# Altium schematic sheet IOs.SchDoc
size A3; SheetNumber: 9; SheetTotal: 9
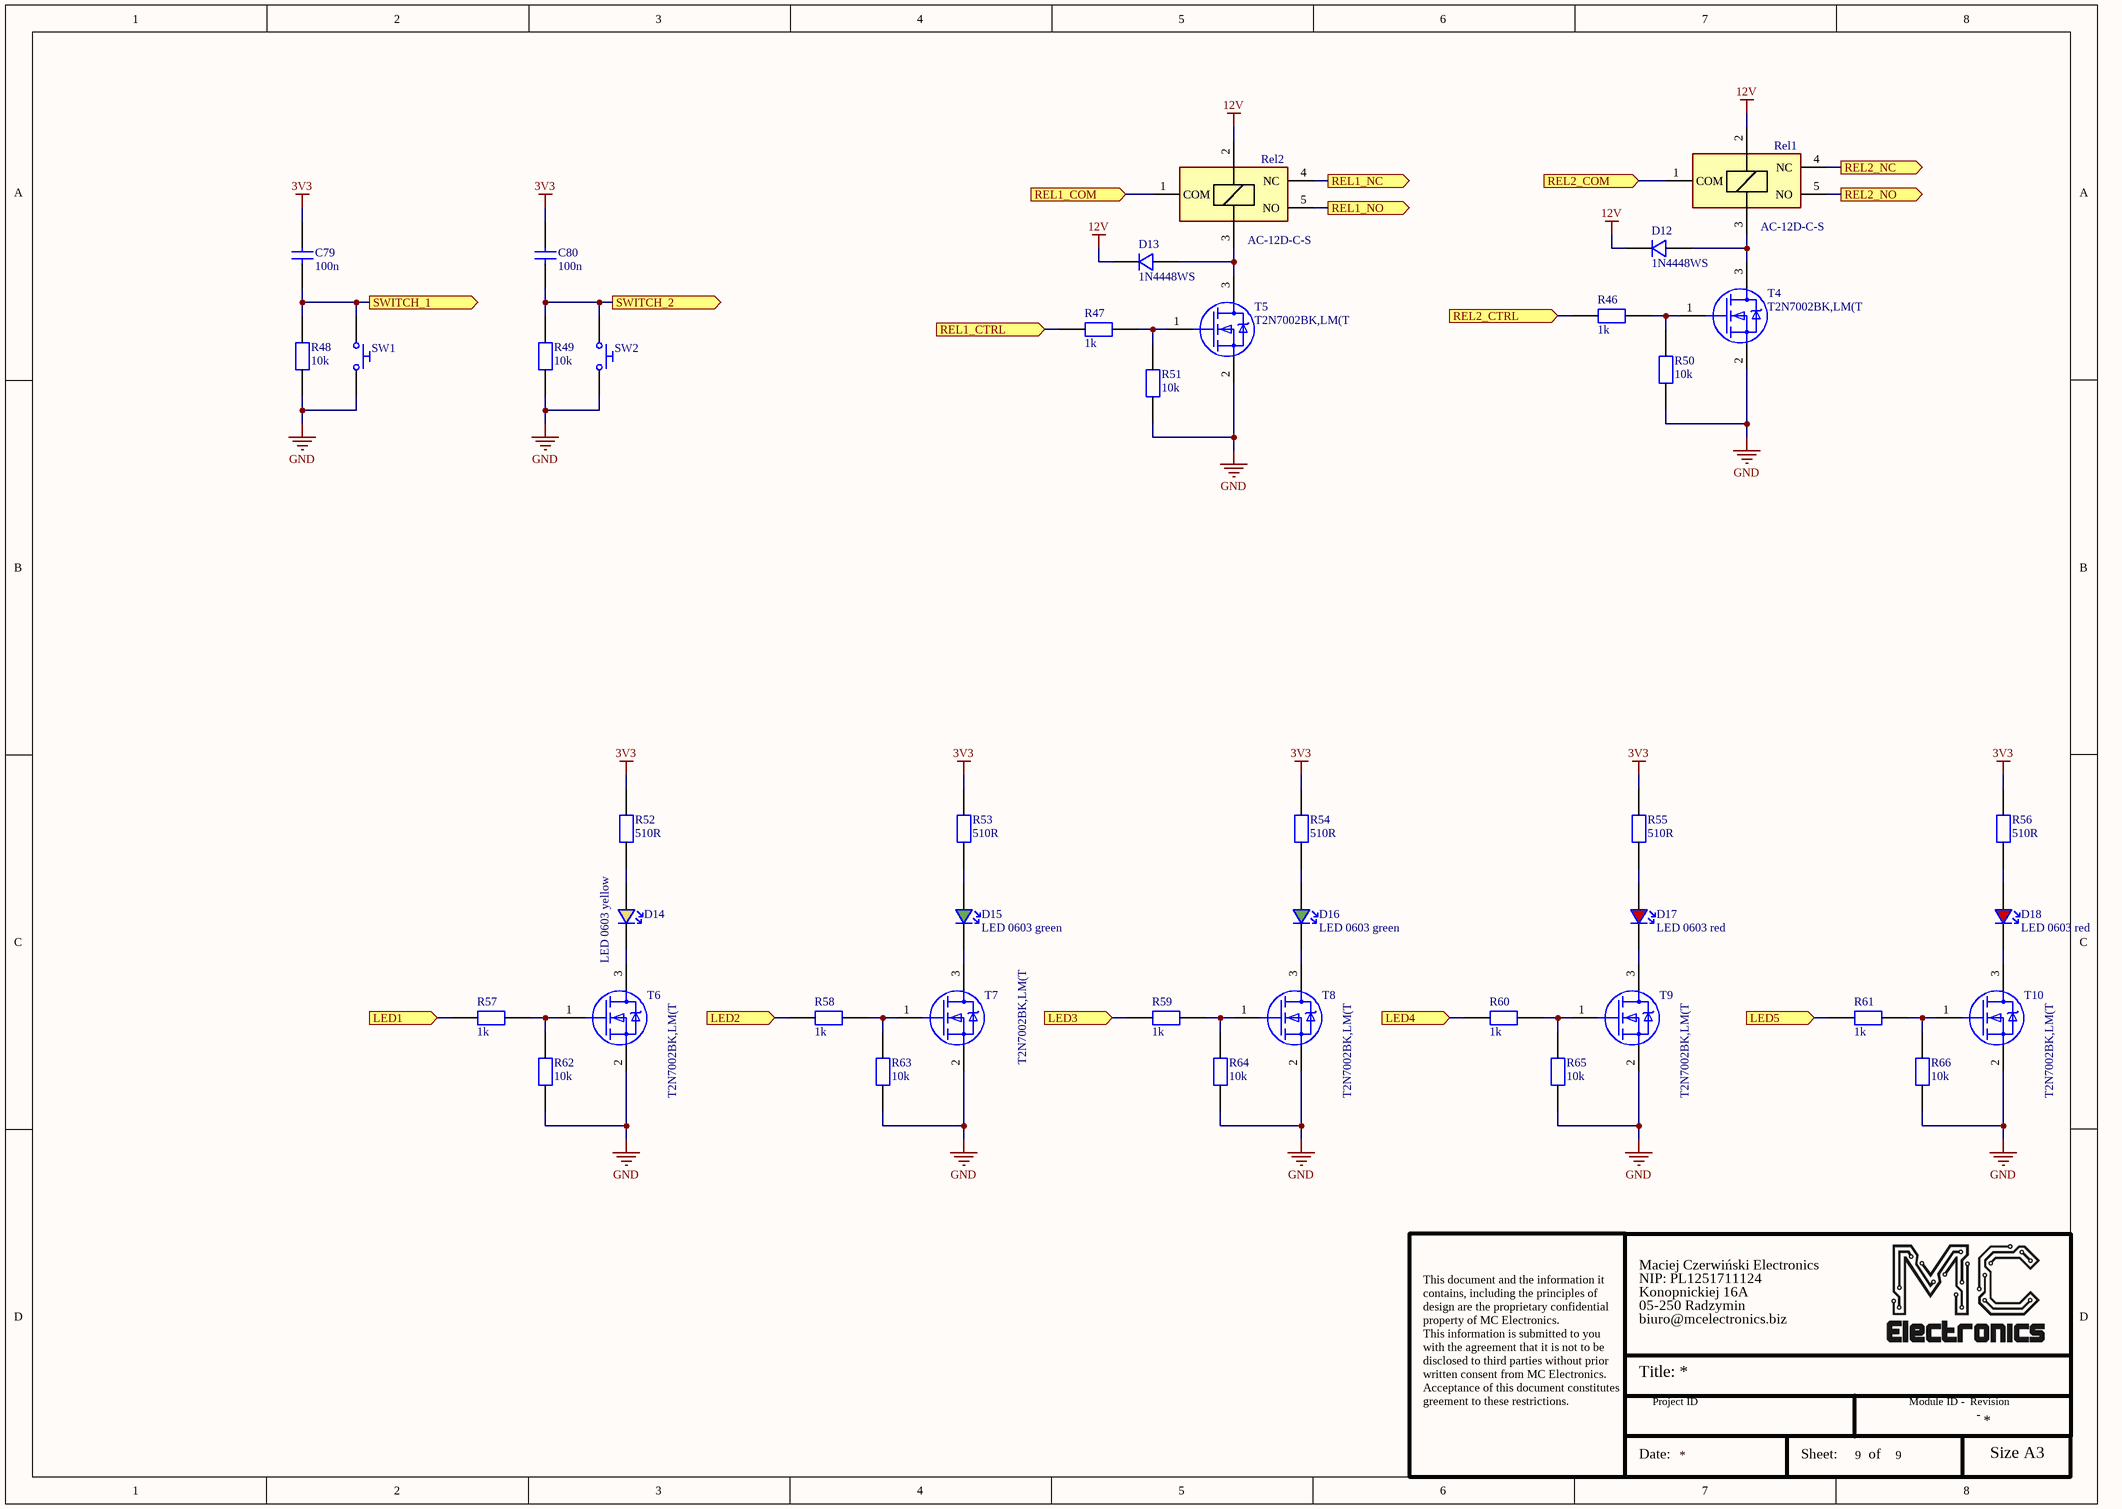
[diagram p0: IOs.SchDoc]

## Parts
C79  value 100n  [0603C]  (hidden comment: 100nF 50V X7R 10%)
C80  value 100n  [0603C]  (hidden comment: 100nF 50V X7R 10%)
D12  1N4448WS  [SODFL255125X120N]
D13  1N4448WS  [SODFL255125X120N]
D14  LED 0603 yellow  [0603LED_YELLOW]
D15  LED 0603 green  [0603LED_GREEN]
D16  LED 0603 green  [0603LED_GREEN]
D17  LED 0603 red  [0603LED_RED]
D18  LED 0603 red  [0603LED_RED]
R46  value 1k  [0603R]  (hidden comment: 1k 1% 0.1W)
R47  value 1k  [0603R]  (hidden comment: 1k 1% 0.1W)
R48  value 10k  [0603R]  (hidden comment: 10k 1% 0.1W)
R49  value 10k  [0603R]  (hidden comment: 10k 1% 0.1W)
R50  value 10k  [0603R]  (hidden comment: 10k 1% 0.1W)
R51  value 10k  [0603R]  (hidden comment: 10k 1% 0.1W)
R52  value 510R  [0603R]  (hidden comment: 510R 1% 0.1W)
R53  value 510R  [0603R]  (hidden comment: 510R 1% 0.1W)
R54  value 510R  [0603R]  (hidden comment: 510R 1% 0.1W)
R55  value 510R  [0603R]  (hidden comment: 510R 1% 0.1W)
R56  value 510R  [0603R]  (hidden comment: 510R 1% 0.1W)
R57  value 1k  [0603R]  (hidden comment: 1k 1% 0.1W)
R58  value 1k  [0603R]  (hidden comment: 1k 1% 0.1W)
R59  value 1k  [0603R]  (hidden comment: 1k 1% 0.1W)
R60  value 1k  [0603R]  (hidden comment: 1k 1% 0.1W)
R61  value 1k  [0603R]  (hidden comment: 1k 1% 0.1W)
R62  value 10k  [0603R]  (hidden comment: 10k 1% 0.1W)
R63  value 10k  [0603R]  (hidden comment: 10k 1% 0.1W)
R64  value 10k  [0603R]  (hidden comment: 10k 1% 0.1W)
R65  value 10k  [0603R]  (hidden comment: 10k 1% 0.1W)
R66  value 10k  [0603R]  (hidden comment: 10k 1% 0.1W)
Rel1  AC-12D-C-S  [AC-12D-C-S]
Rel2  AC-12D-C-S  [AC-12D-C-S]
SW1  Tact switch 6x6mm 7mm height SMD  [TACT switch SMT 7mm height]  (value not drawn)
SW2  Tact switch 6x6mm 7mm height SMD  [TACT switch SMT 7mm height]  (value not drawn)
T4  T2N7002BK,LM(T  [SOT95P235X110-3N]
T5  T2N7002BK,LM(T  [SOT95P235X110-3N]
T6  T2N7002BK,LM(T  [SOT95P235X110-3N]
T7  T2N7002BK,LM(T  [SOT95P235X110-3N]
T8  T2N7002BK,LM(T  [SOT95P235X110-3N]
T9  T2N7002BK,LM(T  [SOT95P235X110-3N]
T10  T2N7002BK,LM(T  [SOT95P235X110-3N]

## Ports
LED1 (in), LED2 (in), LED3 (in), LED4 (in), LED5 (in), REL1_COM (in), REL1_CTRL (in), REL1_NC (out), REL1_NO (out), REL2_COM (in), REL2_CTRL (in), REL2_NC (out), REL2_NO (out), SWITCH_1 (out), SWITCH_2 (out)

## Nets
3V3: C79.2 C80.2 R52.1 R53.1 R54.1 R55.1 R56.1
12V: D12.1 D13.1 Rel1.2(COIL1) Rel2.2(COIL1)
GND: R48.2 R49.2 R50.2 R51.2 R62.2 R63.2 R64.2 R65.2 R66.2 SW1.2 SW2.2 T4.2(E) T5.2(E) T6.2(E) T7.2(E) T8.2(E) T9.2(E) T10.2(E)
LED1: R57.2 ; port LED1
LED2: R58.2 ; port LED2
LED3: R59.2 ; port LED3
LED4: R60.2 ; port LED4
LED5: R61.2 ; port LED5
REL1_COM: Rel2.1(COM) ; port REL1_COM
REL1_CTRL: R47.2 ; port REL1_CTRL
REL1_NC: Rel2.4(NC) ; port REL1_NC
REL1_NO: Rel2.5(NO) ; port REL1_NO
REL2_COM: Rel1.1(COM) ; port REL2_COM
REL2_CTRL: R46.2 ; port REL2_CTRL
REL2_NC: Rel1.4(NC) ; port REL2_NC
REL2_NO: Rel1.5(NO) ; port REL2_NO
SWITCH_1: C79.1 R48.1 SW1.1 ; port SWITCH_1
SWITCH_2: C80.1 R49.1 SW2.1 ; port SWITCH_2
NetD12_2: D12.2 Rel1.3(COIL2) T4.3(C)
NetD13_2: D13.2 Rel2.3(COIL2) T5.3(C)
NetD14_1: D14.1 R52.2
NetD14_2: D14.2 T6.3(C)
NetD15_1: D15.1 R53.2
NetD15_2: D15.2 T7.3(C)
NetD16_1: D16.1 R54.2
NetD16_2: D16.2 T8.3(C)
NetD17_1: D17.1 R55.2
NetD17_2: D17.2 T9.3(C)
NetD18_1: D18.1 R56.2
NetD18_2: D18.2 T10.3(C)
NetR46_1: R46.1 R50.1 T4.1(B)
NetR47_1: R47.1 R51.1 T5.1(B)
NetR57_1: R57.1 R62.1 T6.1(B)
NetR58_1: R58.1 R63.1 T7.1(B)
NetR59_1: R59.1 R64.1 T8.1(B)
NetR60_1: R60.1 R65.1 T9.1(B)
NetR61_1: R61.1 R66.1 T10.1(B)

## Notes on the sheet
- This document and the information it
- contains, including the principles of
- design are the proprietary confidential
- property of MC Electronics.
- Maciej Czerwiński Electronics
- NIP: PL1251711124
- Konopnickiej 16A
- 05-250 Radzymin
- biuro@mcelectronics.biz
- This information is submitted to you
- with the agreement that it is not to be
- disclosed to third parties without prior
- written consent from MC Electronics.
- Acceptance of this document constitutes
- Title:
- greement to these restrictions.
- Date:
- Project ID
- Sheet:
- of
- Module ID -
- Revision
- -
- Size A3

## Library data of the parts
C79 C80 = GEN_100nF_50V_X7R_10%_0603: Generic capacitor 100n 0603; MC_ID: C00001; Generic: Yes; Mount type: SMT
D12 D13 = 1N4448WS: 1N4448WS Switching diode 75V, 0,25A; Generic: No; MC_ID: D00139; Mount type: SMT; Specific PN: 1N4448WS
D14 = LED 0603 yellow: Generic yellow LED 0603; Generic: Yes; MC_ID: -; Specific PN: -; Mount type: SMT
D15 D16 = LED 0603 green: Generic green LED 0603; Generic: Yes; MC_ID: -; Specific PN: -; Mount type: SMT
D17 D18 = LED 0603 red: Generic red LED 0603; Generic: Yes; Mount type: SMT; MC_ID: -; Specific PN: -
R46 R47 R57-R61 = GEN_1k_1%_0.1W_0603: Generic resistor 1k 0603; Generic: Yes; MC_ID: R00027; Mount type: SMT
R48-R51 R62-R66 = GEN_10k_1%_0.1W_0603: Generic resistor 10k 0603; MC_ID: R00003; Generic: Yes; Mount type: SMT
R52-R56 = GEN_510R_1%_0.1W_0603: Generic resistor 510R 0603; Generic: Yes; MC_ID: R00005; Mount type: SMT
Rel1 Rel2 = AC-12D-C-S: Przekaźnik: elektromagnetyczny; SPST-NO; Ucewki: 12VDC; 15A/14VDC; MC_ID: REL00016; Generic: No; Mount type: THT; Specific PN: AC-12D-C-S
SW1 SW2 = WE_430152070826: MC_ID: SW00084; Generic: Yes; Mount type: SMT; Specific PN: WE_430152070826
T4-T10 = T2N7002BK,LM(T: T2N7002BK,LM(T N-MOSFET 60V 0,4A GSD SOT23; Generic: No; MC_ID: TPO00095; Mount type: SMT; Specific PN: T2N7002BK,LM(T